# Altium schematic sheet Battery-Voltage.SchDoc
size B; SheetNumber: 2; SheetTotal: 4
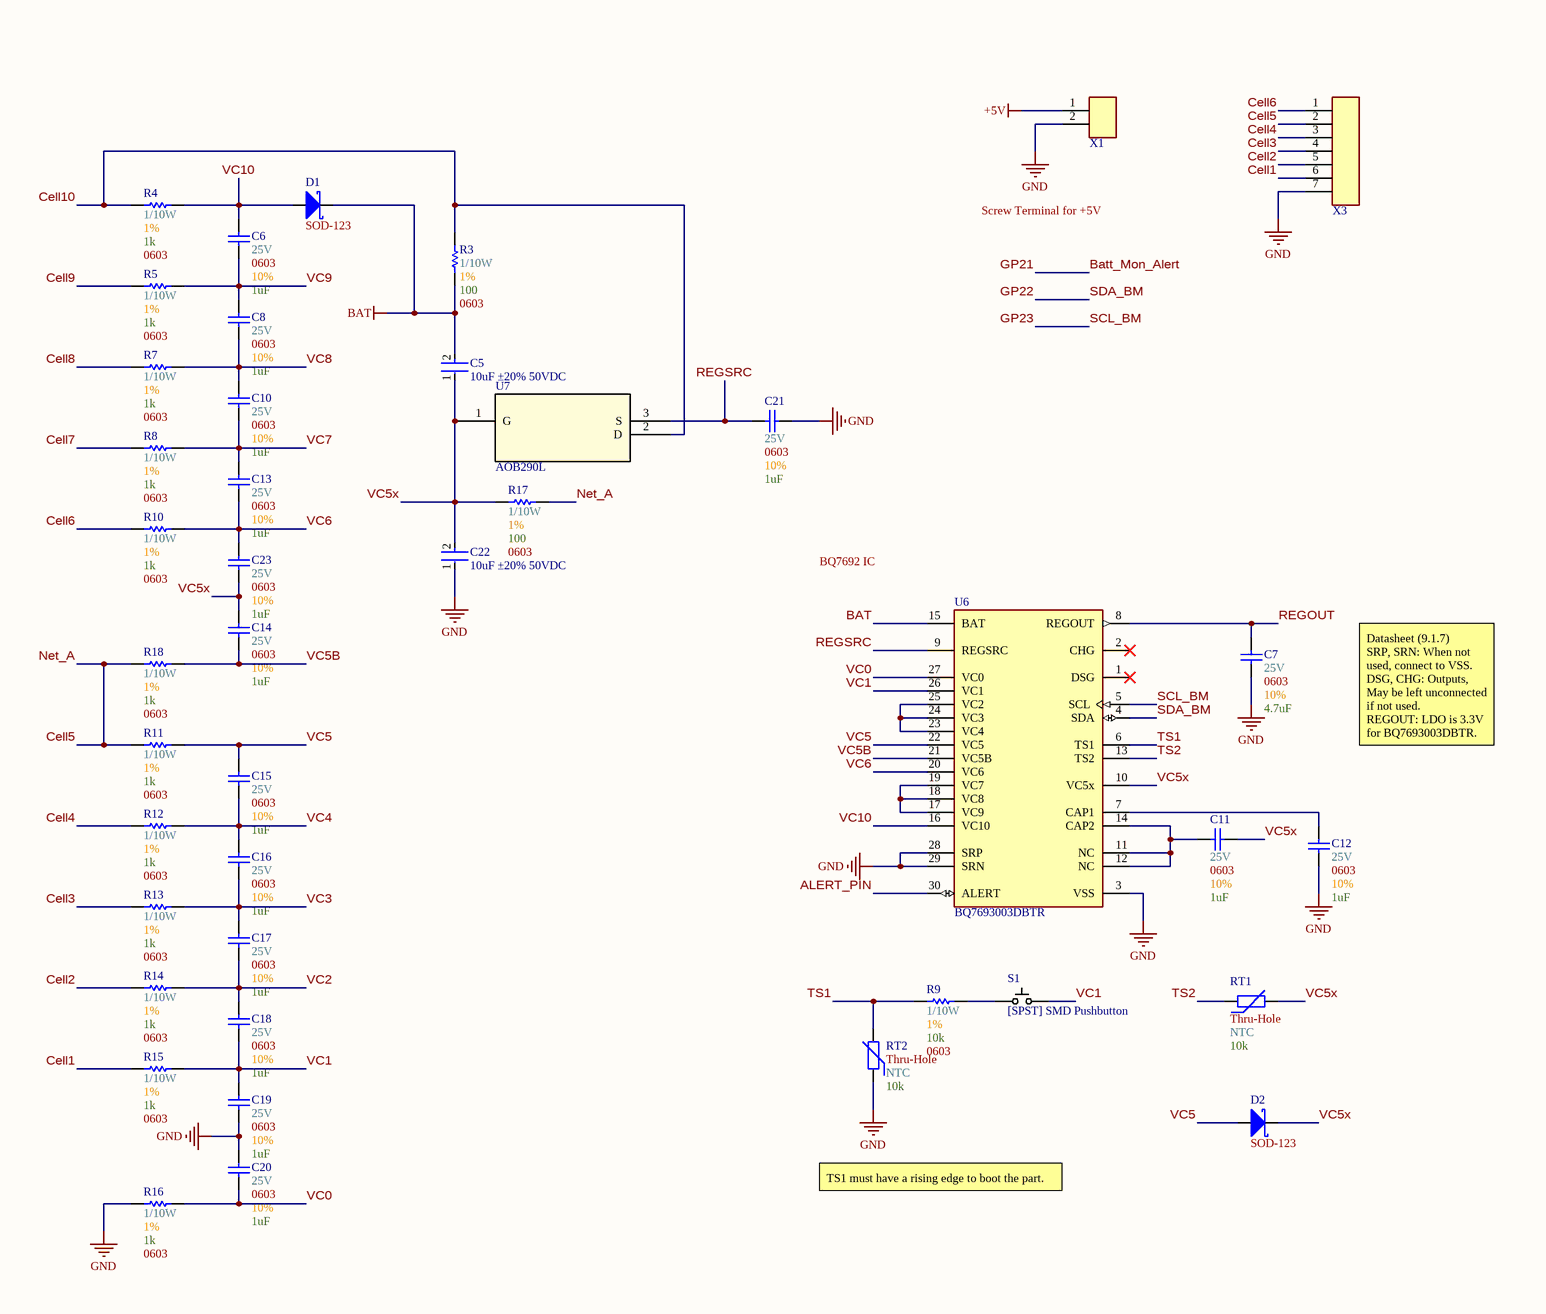
[diagram p0: Battery-Voltage.SchDoc, left]
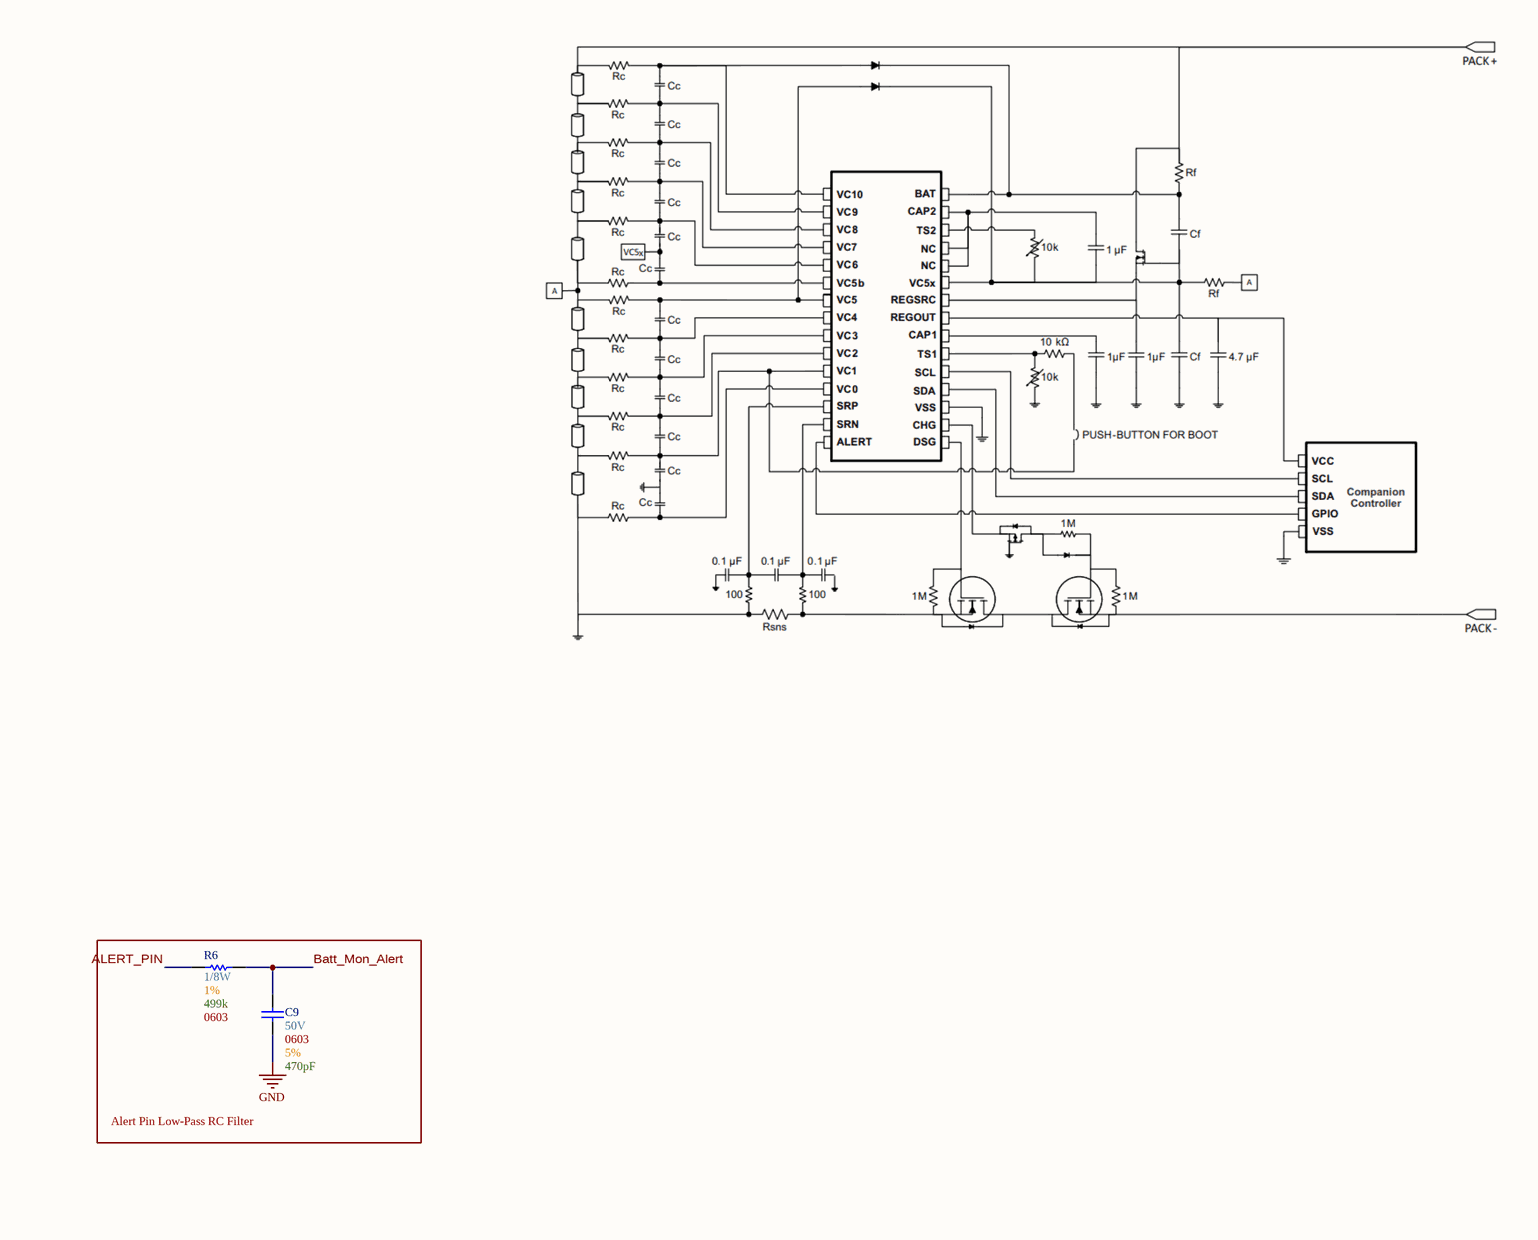
[diagram p1: Battery-Voltage.SchDoc, right]

## Parts
C5  10uF ±20% 50VDC  [FP-GCM32E-0_3-MFG]
C6  Max Voltage: 25V  Size Package: 0603  Tolerance: 10%  Capacitance: 1uF  [[Cap] SMD 0603]  (hidden comment: [Cap] 0603 1uF 10% 25V)
C7  Max Voltage: 25V  Size Package: 0603  Tolerance: 10%  Capacitance: 4.7uF  [[Cap] SMD 0603]  (hidden comment: [Cap] 0603 4.7uF 10% 25V)
C8  Max Voltage: 25V  Size Package: 0603  Tolerance: 10%  Capacitance: 1uF  [[Cap] SMD 0603]  (hidden comment: [Cap] 0603 1uF 10% 25V)
C9  Max Voltage: 50V  Size Package: 0603  Tolerance: 5%  Capacitance: 470pF  [[Cap] SMD 0603]  (hidden comment: [Cap] 0603 470pF 5% 50V)
C10  Max Voltage: 25V  Size Package: 0603  Tolerance: 10%  Capacitance: 1uF  [[Cap] SMD 0603]  (hidden comment: [Cap] 0603 1uF 10% 25V)
C11  Max Voltage: 25V  Size Package: 0603  Tolerance: 10%  Capacitance: 1uF  [[Cap] SMD 0603]  (hidden comment: [Cap] 0603 1uF 10% 25V)
C12  Max Voltage: 25V  Size Package: 0603  Tolerance: 10%  Capacitance: 1uF  [[Cap] SMD 0603]  (hidden comment: [Cap] 0603 1uF 10% 25V)
C13  Max Voltage: 25V  Size Package: 0603  Tolerance: 10%  Capacitance: 1uF  [[Cap] SMD 0603]  (hidden comment: [Cap] 0603 1uF 10% 25V)
C14  Max Voltage: 25V  Size Package: 0603  Tolerance: 10%  Capacitance: 1uF  [[Cap] SMD 0603]  (hidden comment: [Cap] 0603 1uF 10% 25V)
C15  Max Voltage: 25V  Size Package: 0603  Tolerance: 10%  Capacitance: 1uF  [[Cap] SMD 0603]  (hidden comment: [Cap] 0603 1uF 10% 25V)
C16  Max Voltage: 25V  Size Package: 0603  Tolerance: 10%  Capacitance: 1uF  [[Cap] SMD 0603]  (hidden comment: [Cap] 0603 1uF 10% 25V)
C17  Max Voltage: 25V  Size Package: 0603  Tolerance: 10%  Capacitance: 1uF  [[Cap] SMD 0603]  (hidden comment: [Cap] 0603 1uF 10% 25V)
C18  Max Voltage: 25V  Size Package: 0603  Tolerance: 10%  Capacitance: 1uF  [[Cap] SMD 0603]  (hidden comment: [Cap] 0603 1uF 10% 25V)
C19  Max Voltage: 25V  Size Package: 0603  Tolerance: 10%  Capacitance: 1uF  [[Cap] SMD 0603]  (hidden comment: [Cap] 0603 1uF 10% 25V)
C20  Max Voltage: 25V  Size Package: 0603  Tolerance: 10%  Capacitance: 1uF  [[Cap] SMD 0603]  (hidden comment: [Cap] 0603 1uF 10% 25V)
C21  Max Voltage: 25V  Size Package: 0603  Tolerance: 10%  Capacitance: 1uF  [[Cap] SMD 0603]  (hidden comment: [Cap] 0603 1uF 10% 25V)
C22  10uF ±20% 50VDC  [FP-GCM32E-0_3-MFG]
C23  Max Voltage: 25V  Size Package: 0603  Tolerance: 10%  Capacitance: 1uF  [[Cap] SMD 0603]  (hidden comment: [Cap] 0603 1uF 10% 25V)
D1  Footprint: SOD-123  [[Diode] SMD SOD-123]  (hidden comment: SOD123)
D2  Footprint: SOD-123  [[Diode] SMD SOD-123]  (hidden comment: SOD123)
R3  Wattage: 1/10W  Tolerance: 1%  Resistance: 100  Size Package: 0603  [[Res] SMD 0603]  (hidden comment: [100] SMD 0603 1% 1/10W)
R4  Wattage: 1/10W  Tolerance: 1%  Resistance: 1k  Size Package: 0603  [[Res] SMD 0603]  (hidden comment: [1k] SMD 0603 1% 1/10W)
R5  Wattage: 1/10W  Tolerance: 1%  Resistance: 1k  Size Package: 0603  [[Res] SMD 0603]  (hidden comment: [1k] SMD 0603 1% 1/10W)
R6  Wattage: 1/8W  Tolerance: 1%  Resistance: 499k  Size Package: 0603  [[Res] SMD 0603]  (hidden comment: [499k] SMD 0603 1% 1/8W)
R7  Wattage: 1/10W  Tolerance: 1%  Resistance: 1k  Size Package: 0603  [[Res] SMD 0603]  (hidden comment: [1k] SMD 0603 1% 1/10W)
R8  Wattage: 1/10W  Tolerance: 1%  Resistance: 1k  Size Package: 0603  [[Res] SMD 0603]  (hidden comment: [1k] SMD 0603 1% 1/10W)
R9  Wattage: 1/10W  Tolerance: 1%  Resistance: 10k  Size Package: 0603  [[Res] SMD 0603]  (hidden comment: [10k] SMD 0603 1% 1/8W)
R10  Wattage: 1/10W  Tolerance: 1%  Resistance: 1k  Size Package: 0603  [[Res] SMD 0603]  (hidden comment: [1k] SMD 0603 1% 1/10W)
R11  Wattage: 1/10W  Tolerance: 1%  Resistance: 1k  Size Package: 0603  [[Res] SMD 0603]  (hidden comment: [1k] SMD 0603 1% 1/10W)
R12  Wattage: 1/10W  Tolerance: 1%  Resistance: 1k  Size Package: 0603  [[Res] SMD 0603]  (hidden comment: [1k] SMD 0603 1% 1/10W)
R13  Wattage: 1/10W  Tolerance: 1%  Resistance: 1k  Size Package: 0603  [[Res] SMD 0603]  (hidden comment: [1k] SMD 0603 1% 1/10W)
R14  Wattage: 1/10W  Tolerance: 1%  Resistance: 1k  Size Package: 0603  [[Res] SMD 0603]  (hidden comment: [1k] SMD 0603 1% 1/10W)
R15  Wattage: 1/10W  Tolerance: 1%  Resistance: 1k  Size Package: 0603  [[Res] SMD 0603]  (hidden comment: [1k] SMD 0603 1% 1/10W)
R16  Wattage: 1/10W  Tolerance: 1%  Resistance: 1k  Size Package: 0603  [[Res] SMD 0603]  (hidden comment: [1k] SMD 0603 1% 1/10W)
R17  Wattage: 1/10W  Tolerance: 1%  Resistance: 100  Size Package: 0603  [[Res] SMD 0603]  (hidden comment: [100] SMD 0603 1% 1/10W)
R18  Wattage: 1/10W  Tolerance: 1%  Resistance: 1k  Size Package: 0603  [[Res] SMD 0603]  (hidden comment: [1k] SMD 0603 1% 1/10W)
RT1  Mounting Style: Thru-Hole  Technology: NTC  Res at 25degC: 10k  [[NTC] 10k Thru-Hole]  (hidden comment: [NTC] 10k Thru-Hole)
RT2  Mounting Style: Thru-Hole  Technology: NTC  Res at 25degC: 10k  [[NTC] 10k Thru-Hole]  (hidden comment: [NTC] 10k Thru-Hole)
S1  [SPST] SMD Pushbutton  [[SPST] SMD Pushbutton]
U6  BQ7693003DBTR  [FP-DBT0030A-MFG]
U7  AOB290L  [TO-263-3_AOS]
X1  2pin Screw Terminal  [[Screw Terminal] 2pin 5mm]  (value not drawn)
X3  [JST] 7pin 90deg 2.54mm pitch  [[JST] 7pin 90deg 2.54mm pitch]  (value not drawn)

## Blocks framed on the sheet
Alert Pin Low-Pass RC Filter: C9 R6

## Nets
+5V: X1.1
BAT: C5.2 D1.1(K) R3.1 U6.15(BAT)
GND: C7.1 C9.1 C12.1 C19.1 C20.2 C21.1 C22.1 R16.1 RT2.1 U6.3(VSS) U6.28(SRP) U6.29(SRN) X1.2 X3.7
ALERT_PIN: R6.1 U6.30(ALERT)
Batt_Mon_Alert: C9.2 R6.2  [also labelled GP21]
Cell1: R15.1 X3.6
Cell2: R14.1 X3.5
Cell3: R13.1 X3.4
Cell4: R12.1 X3.3
Cell5: R11.1 R17.1 R18.1 X3.2  [also labelled Net_A]
Cell6: R10.1 X3.1
Cell7: R8.1
Cell8: R7.1
Cell9: R5.1
Cell10: R3.2 R4.1 U7.2(D)
GP22: U6.4(SDA)  [also labelled SDA_BM]
GP23: U6.5(SCL)  [also labelled SCL_BM]
REGOUT: C7.2 U6.8(REGOUT)
REGSRC: C21.2 U6.9(REGSRC) U7.3(S)
TS1: R9.1 RT2.2 U6.6(TS1)
TS2: RT1.1 U6.13(TS2)
VC0: C20.1 R16.2 U6.27(VC0)
VC1: C18.1 C19.2 R15.2 S1.2 U6.26(VC1)
VC2: C17.1 C18.2 R14.2
VC3: C16.1 C17.2 R13.2
VC4: C15.1 C16.2 R12.2
VC5: C15.2 D2.2(A) R11.2 U6.22(VC5)
VC5B: C14.1 R18.2 U6.21(VC5B)
VC5x: C5.1 C11.1 C14.2 C22.2 C23.1 D2.1(K) R17.2 RT1.2 U6.10(VC5x) U7.1(G)
VC6: C13.1 C23.2 R10.2 U6.20(VC6)
VC7: C10.1 C13.2 R8.2
VC8: C8.1 C10.2 R7.2
VC9: C6.1 C8.2 R5.2
VC10: C6.2 D1.2(A) R4.2 U6.16(VC10)
NetC11_2: C11.2 U6.11(NC) U6.12(NC) U6.14(CAP2)
NetC12_2: C12.2 U6.7(CAP1)
NetR9_2: R9.2 S1.1
NetU6_17: U6.17(VC9) U6.18(VC8) U6.19(VC7)
NetU6_23: U6.23(VC4) U6.24(VC3) U6.25(VC2)

Not connected (* = marked no-connect by the designer): U6 1(DSG)* 2(CHG)*

## Notes on the sheet
- Screw Terminal for +5V
- BQ7692 IC
- Datasheet (9.1.7)
  SRP, SRN: When not used, connect to VSS.
  DSG, CHG: Outputs, May be left unconnected if not used.
  REGOUT: LDO is 3.3V for BQ7693003DBTR.
- TS1 must have a rising edge to boot the part.

## Library data of the parts
C5 C22 = CMP-06035-056560-1: GCM32EC71H106MA03K Ceramic Capacitor for Automotive 10uF ±20% 50VDC X7S 1210 Embossed T/R
C6 C8 C10-C21 C23 = [Cap] 0603 1uF 10% 25V: CL10B105KA8NNNC; Supplier 1: DigiKey; Supplier Part Number 1: 1276-1184-1-ND
C7 = [Cap] 0603 4.7uF 10% 25V: GRM188R61E475KE11D; Supplier 1: DigiKey; Supplier Part Number 1: 490-7203-6-ND
C9 = [Cap] 0603 470pF 5% 50V: CL10C471JB8NNNC; Supplier 1: DigiKey; Supplier Part Number 1: 1276-1168-1-ND
D1 D2 = [Schottky] SMD 40V 1A: B5819W-TP; Supplier 1: DigiKey; Supplier Part Number 1: B5819W-TPMSCT-ND
R3 R17 = [100] SMD 0603 1% 1/10W: RC0603FR-07100RL; Supplier 1: DigiKey; Supplier Part Number 1: 311-100HRDKR-ND
R4 R5 R7 R8 R10-R16 R18 = [1k] SMD 0603 1% 1/10W: RMCF0603FT1K00; Supplier 1: DigiKey; Supplier Part Number 1: RMCF0603FT1K00DKR-ND
R6 = [499k] SMD 0603 1% 1/8W: CRCW0603499KFKEA; Supplier 1: DigiKey; Supplier Part Number 1: 541-499KHDKR-ND
R9 = [10k] SMD 0603 1% 1/8W: RMCF0603FT10K0; Supplier 1: DigiKey; Supplier Part Number 1: RMCF0603FT10K0DKR-ND
RT1 RT2 = [NTC] 10k Thru-Hole: B57164K0103J000; Supplier 1: DigiKey; Supplier Part Number 1: 495-2080-ND
S1 = [SPST] SMD Pushbutton: PTS815SJM250SMTRLFS; Supplier 1: DigiKey; Supplier Part Number 1: CKN12215-6-ND
U6 = CMP-04911-000006-1: IC BATT MGMT LI-ION AFE 30TSSOP; Manufacturer: Texas Instruments; Max Supply Voltage: 25V; Nominal Supply Current: 40-130uA; Number Of Outputs: 2; Number Of Cells: 10; Standoff Height: 0.05mm; Min Supply Voltage: 6V; Octopart: https://octopart.com/bq7693003dbtr-texas+instruments-34472212; Digikey Description: IC BATT MGMT LI-ION AFE 30TSSOP; Ipc Land Pattern Name: SOP50P635X120-30; Mouser Description: 6 to 10-Series Cell Li-Ion and Li-Phosphate Battery Monitor (bq76940 Family) 30-TSSOP -40 to 85; Package: DBT0030A; Manufacturer Part Number: BQ7693003DBTR; Device Class L1: Integrated Circuits (ICs); Temperature Range High: +85°C; RoHS: TRUE; Category: IC; Temperature: -40°C to +85°C; Automotive: No; Device Class L3: Battery Management; ComponentLink2Description: Datasheet; Device Class L2: Power Management ICs; ComponentLink2URL: http://www.ti.com/lit/ds/symlink/bq76930.pdf; Height: 1.2mm; Temperature Range Low: -40°C; Lead Free: Yes
U7 = AOB290L: Description; Manufacturer_Name: Alpha and Omega Semiconductor; Copyright: Copyright (C) 2025 Ultra Librarian. All rights reserved.; Manufacturer_Part_Number: AOB290L; RefDes: RefDes; Type: Type
X1 = [Screw Terminal] 2pin: TB002-500-02BE; Supplier 1: DigiKey; Supplier Part Number 1: 102-6145-ND